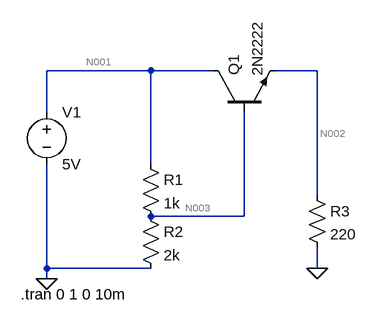
[diagram p0: schematic 2v5-voltage-regulator.asc]
2v5-voltage-regulator.asc, the LTspice schematic file:
Version 4.1
SHEET 1 880 680
WIRE 288 -32 128 -32
WIRE 384 -32 288 -32
WIRE 544 -32 480 -32
WIRE 128 32 128 -32
WIRE 288 112 288 -32
WIRE 544 160 544 -32
WIRE 432 192 432 32
WIRE 432 192 288 192
WIRE 128 272 128 112
WIRE 288 272 128 272
WIRE 544 272 544 240
WIRE 128 288 128 272
FLAG 128 288 0
FLAG 544 272 0
SYMBOL voltage 128 16 R0
SYMATTR InstName V1
SYMATTR Value 5V
SYMBOL res 272 96 R0
SYMATTR InstName R1
SYMATTR Value 1k
SYMBOL res 272 176 R0
SYMATTR InstName R2
SYMATTR Value 2k
SYMBOL npn 384 32 R270
SYMATTR InstName Q1
SYMATTR Value 2N2222
SYMBOL res 528 144 R0
SYMATTR InstName R3
SYMATTR Value 220
TEXT 88 312 Left 2 !.tran 0 1 0 10m

The netlist it stands for:
* 2v5-voltage-regulator.asc
V1 N001 0 5V
R1 N001 N003 1k
R2 N003 0 2k
Q1 N001 N003 N002 0 2N2222
R3 N002 0 220
.model NPN NPN
.model PNP PNP
.lib standard.bjt
.tran 0 1 0 10m
.backanno
.end

* Results of the author's LTspice run, read from the files saved beside the schematic
* Operating Point, zero values left out:
*   V(n001) = 5 V
*   V(n002) = 2.572 V
*   V(n003) = 3.294 V
*   I(R1) = 1.706 mA
*   I(R2) = 1.647 mA
*   I(R3) = 11.69 mA
*   I(V1) = -13.34 mA
*   Ib(Q1) = 59.36 µA
*   Ic(Q1) = 11.63 mA
*   Ie(Q1) = -11.69 mA